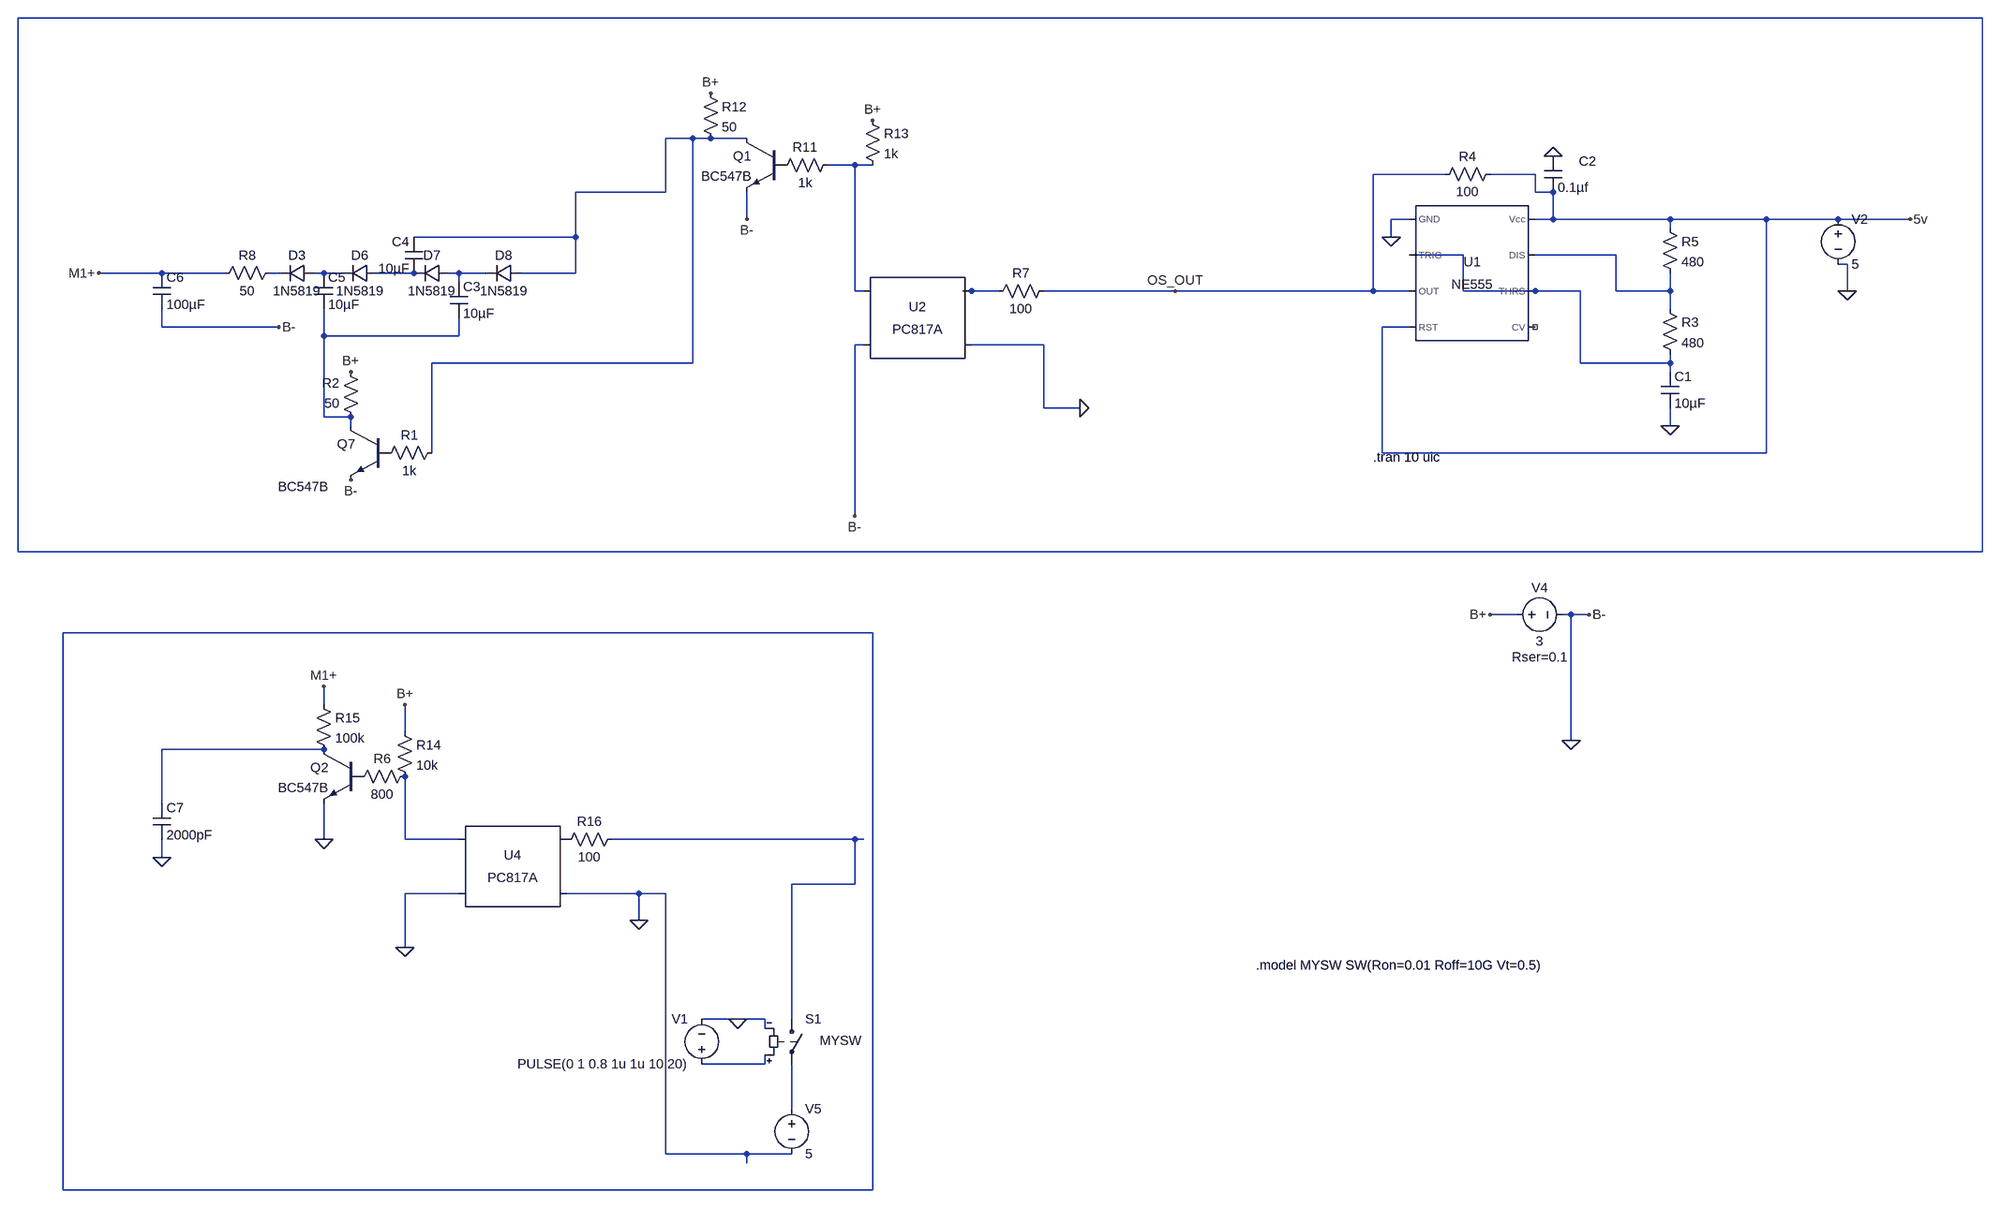
[diagram p0: schematic MOSFET_driver_circuit.asc]
MOSFET_driver_circuit.asc, the LTspice schematic file:
Version 4.1
SHEET 1 2420 1616
WIRE 2416 -1232 -1232 -1232
WIRE -32 -1008 -80 -1008
WIRE 0 -1008 -32 -1008
WIRE 64 -1008 0 -1008
WIRE 256 -960 208 -960
WIRE 288 -960 256 -960
WIRE 1456 -944 1328 -944
WIRE 1616 -944 1536 -944
WIRE -80 -912 -80 -1008
WIRE -80 -912 -240 -912
WIRE 1616 -912 1616 -944
WIRE 1648 -912 1616 -912
WIRE 64 -864 64 -912
WIRE 1392 -864 1360 -864
WIRE 1648 -864 1648 -912
WIRE 1648 -864 1616 -864
WIRE 1856 -864 1648 -864
WIRE 2032 -864 1856 -864
WIRE 2160 -864 2032 -864
WIRE 2288 -864 2160 -864
WIRE 1856 -848 1856 -864
WIRE -240 -832 -240 -912
WIRE -240 -832 -528 -832
WIRE 1360 -832 1360 -864
WIRE 1488 -800 1392 -800
WIRE 1760 -800 1616 -800
WIRE 2176 -784 2160 -784
WIRE -976 -768 -1088 -768
WIRE -864 -768 -976 -768
WIRE -768 -768 -784 -768
WIRE -688 -768 -704 -768
WIRE -656 -768 -688 -768
WIRE -528 -768 -592 -768
WIRE -448 -768 -464 -768
WIRE -400 -768 -448 -768
WIRE -240 -768 -240 -832
WIRE -240 -768 -336 -768
WIRE -448 -752 -448 -768
WIRE 256 -736 256 -960
WIRE 272 -736 256 -736
WIRE 464 -736 448 -736
WIRE 512 -736 464 -736
WIRE 976 -736 592 -736
WIRE 1328 -736 1328 -944
WIRE 1328 -736 976 -736
WIRE 1392 -736 1328 -736
WIRE 1488 -736 1488 -800
WIRE 1616 -736 1488 -736
WIRE 1696 -736 1616 -736
WIRE 1760 -736 1760 -800
WIRE 1856 -736 1856 -768
WIRE 1856 -736 1760 -736
WIRE 2176 -736 2176 -784
WIRE 1856 -704 1856 -736
WIRE -976 -672 -976 -704
WIRE -768 -672 -976 -672
WIRE 1392 -672 1344 -672
WIRE -688 -656 -688 -704
WIRE -448 -656 -448 -688
WIRE -448 -656 -688 -656
WIRE 272 -640 256 -640
WIRE 592 -640 464 -640
WIRE -32 -608 -32 -1008
WIRE -32 -608 -496 -608
WIRE 1696 -608 1696 -736
WIRE 1856 -608 1856 -624
WIRE 1856 -608 1696 -608
WIRE 1856 -592 1856 -608
WIRE 592 -528 592 -640
WIRE 656 -528 592 -528
WIRE -688 -512 -688 -656
WIRE -640 -512 -688 -512
WIRE -640 -496 -640 -512
WIRE 1856 -496 1856 -528
WIRE -496 -448 -496 -608
WIRE 1344 -448 1344 -672
WIRE 2032 -448 2032 -864
WIRE 2032 -448 1344 -448
WIRE 256 -336 256 -640
WIRE -1232 -272 -1232 -1232
WIRE 2416 -272 2416 -1232
WIRE 2416 -272 -1232 -272
WIRE 1584 -160 1536 -160
WIRE 1680 -160 1664 -160
WIRE 1712 -160 1680 -160
WIRE 288 -128 -1152 -128
WIRE -688 0 -688 -32
WIRE -544 48 -544 0
WIRE 1680 64 1680 -160
WIRE -688 80 -976 80
WIRE -976 176 -976 80
WIRE -688 240 -688 176
WIRE -544 240 -544 128
WIRE -448 240 -544 240
WIRE 256 240 -176 240
WIRE 272 240 256 240
WIRE -976 272 -976 240
WIRE 256 320 256 240
WIRE 256 320 144 320
WIRE -448 336 -544 336
WIRE -128 336 -256 336
WIRE -80 336 -128 336
WIRE -128 384 -128 336
WIRE -544 432 -544 336
WIRE 48 560 -16 560
WIRE 96 560 48 560
WIRE 144 560 144 320
WIRE 96 576 96 560
WIRE 96 640 96 624
WIRE 96 640 -16 640
WIRE 144 720 144 640
WIRE -80 800 -80 336
WIRE 64 800 -80 800
WIRE 144 800 64 800
WIRE 64 816 64 800
WIRE -1152 864 -1152 -128
WIRE 288 864 288 -128
WIRE 288 864 -1152 864
FLAG 1648 -976 0
FLAG 1856 -496 0
FLAG 1360 -832 0
FLAG 2176 -736 0
FLAG 2288 -864 5v
FLAG -768 -672 B-
FLAG -1088 -768 M1+
FLAG 656 -528 0
FLAG 976 -736 OS_OUT
FLAG 1536 -160 B+
FLAG 1712 -160 B-
FLAG 1680 64 0
FLAG 288 -1040 B+
FLAG -640 -400 B-
FLAG -640 -592 B+
FLAG 64 -864 B-
FLAG 0 -1088 B+
FLAG 48 560 0
FLAG -688 -32 M1+
FLAG -544 0 B+
FLAG -544 432 0
FLAG -128 384 0
FLAG -976 272 0
FLAG -688 240 0
FLAG 256 -336 B-
SYMBOL Misc\\NE555 1504 -768 R0
SYMATTR InstName U1
SYMBOL res 1840 -720 R0
SYMATTR InstName R3
SYMATTR Value 480
SYMBOL cap 1840 -592 R0
SYMATTR InstName C1
SYMATTR Value 10µF
SYMBOL cap 1632 -976 R0
WINDOW 0 62 9 Left 2
SYMATTR InstName C2
SYMATTR Value 0.1µf
SYMBOL res 1552 -960 R90
WINDOW 0 0 56 VBottom 2
WINDOW 3 32 56 VTop 2
SYMATTR InstName R4
SYMATTR Value 100
SYMBOL voltage 2160 -880 R0
WINDOW 123 0 0 Left 0
WINDOW 39 0 0 Left 0
SYMATTR InstName V2
SYMATTR Value 5
SYMBOL res 1840 -864 R0
SYMATTR InstName R5
SYMATTR Value 480
SYMBOL cap -464 -752 R0
SYMATTR InstName C3
SYMATTR Value 10µF
SYMBOL cap -512 -768 R180
WINDOW 0 24 56 Left 2
WINDOW 3 24 8 Left 2
SYMATTR InstName C4
SYMATTR Value 10µF
SYMBOL cap -704 -768 R0
SYMATTR InstName C5
SYMATTR Value 10µF
SYMBOL lib\\sym\\Optos\\PC817A 368 -688 M0
SYMATTR InstName U2
SYMBOL res 608 -752 R90
WINDOW 0 0 56 VBottom 2
WINDOW 3 32 56 VTop 2
SYMATTR InstName R7
SYMATTR Value 100
SYMBOL diode -704 -784 R90
WINDOW 0 0 32 VBottom 2
WINDOW 3 32 32 VTop 2
SYMATTR InstName D3
SYMATTR Value 1N5819
SYMBOL cap -992 -768 R0
SYMATTR InstName C6
SYMATTR Value 100µF
SYMBOL res -768 -784 R90
WINDOW 0 0 56 VBottom 2
WINDOW 3 32 56 VTop 2
SYMATTR InstName R8
SYMATTR Value 50
SYMBOL diode -592 -784 R90
WINDOW 0 0 32 VBottom 2
WINDOW 3 32 32 VTop 2
SYMATTR InstName D6
SYMATTR Value 1N5819
SYMBOL diode -464 -784 R90
WINDOW 0 0 32 VBottom 2
WINDOW 3 32 32 VTop 2
SYMATTR InstName D7
SYMATTR Value 1N5819
SYMBOL diode -336 -784 R90
WINDOW 0 0 32 VBottom 2
WINDOW 3 32 32 VTop 2
SYMATTR InstName D8
SYMATTR Value 1N5819
SYMBOL voltage 1568 -160 R270
WINDOW 0 32 56 VTop 2
WINDOW 3 -32 56 VBottom 2
WINDOW 123 0 0 Left 0
WINDOW 39 -60 56 VBottom 2
SYMATTR InstName V4
SYMATTR Value 3
SYMATTR SpiceLine Rser=0.1
SYMBOL res 272 -1056 R0
SYMATTR InstName R13
SYMATTR Value 1k
SYMBOL lib\\sym\\npn -576 -496 M0
WINDOW 3 104 108 Left 2
SYMATTR Value BC547B
SYMATTR InstName Q7
SYMBOL res -480 -464 R90
WINDOW 0 0 56 VBottom 2
WINDOW 3 32 56 VTop 2
SYMATTR InstName R1
SYMATTR Value 1k
SYMBOL res -624 -496 R180
WINDOW 0 36 76 Left 2
WINDOW 3 36 40 Left 2
SYMATTR InstName R2
SYMATTR Value 50
SYMBOL lib\\sym\\npn 128 -1008 M0
SYMATTR InstName Q1
SYMATTR Value BC547B
SYMBOL res 224 -976 R90
WINDOW 0 0 56 VBottom 2
WINDOW 3 32 56 VTop 2
SYMATTR InstName R11
SYMATTR Value 1k
SYMBOL res -16 -1104 R0
SYMATTR InstName R12
SYMATTR Value 50
SYMBOL lib\\sym\\sw 144 544 R0
WINDOW 3 50 54 Left 2
SYMATTR Value MYSW
SYMATTR InstName S1
SYMBOL cap -992 176 R0
SYMATTR InstName C7
SYMATTR Value 2000pF
SYMBOL voltage -16 656 R180
WINDOW 0 24 96 Left 2
WINDOW 3 24 16 Left 2
WINDOW 123 0 0 Left 0
WINDOW 39 0 0 Left 0
SYMATTR InstName V1
SYMATTR Value PULSE(0 1 0.8 1u 1u 10 20)
SYMBOL lib\\sym\\Optos\\PC817A -352 288 M0
SYMATTR InstName U4
SYMBOL lib\\sym\\npn -624 80 M0
SYMATTR InstName Q2
SYMATTR Value BC547B
SYMBOL res -640 144 R270
WINDOW 0 32 56 VTop 2
WINDOW 3 0 56 VBottom 2
SYMATTR InstName R6
SYMATTR Value 800
SYMBOL res -560 32 R0
SYMATTR InstName R14
SYMATTR Value 10k
SYMBOL res -704 -16 R0
SYMATTR InstName R15
SYMATTR Value 100k
SYMBOL voltage 144 704 R0
WINDOW 123 0 0 Left 0
WINDOW 39 0 0 Left 0
SYMATTR InstName V5
SYMATTR Value 5
SYMBOL res -160 224 R90
WINDOW 0 0 56 VBottom 2
WINDOW 3 32 56 VTop 2
SYMATTR InstName R16
SYMATTR Value 100
TEXT 1328 -440 Left 2 !.tran 10 uic
TEXT 1120 464 Left 2 !.model MYSW SW(Ron=0.01 Roff=10G Vt=0.5)

The netlist it stands for:
* MOSFET_driver_circuit.asc
X§U1 0 N004 OS_OUT 5v NC_01 N004 N005 5v NE555  ; pins GND TRIG OUT RST CV THRS DIS Vcc
R3 N005 N004 480
C1 N004 0 10µF
C2 0 5v 0.1µf
R4 5v OS_OUT 100
V2 5v 0 5
R5 5v N005 480
C3 N009 N011 10µF
C4 N008 N002 10µF
C5 N007 N011 10µF
X§U2 N010 0 N003 0 PC817 Igain=1m
R7 OS_OUT N010 100
D3 N007 N006 1N5819
C6 M1+ 0 100µF
R8 N006 M1+ 50
D6 N008 N007 1N5819
D7 N009 N008 1N5819
D8 N002 N009 1N5819
V4 B+ 0 3 Rser=0.1
R13 B+ N003 1k
Q7 N011 P001 0 0 BC547B
R1 N002 P001 1k
R2 N011 B+ 50
Q1 N002 P002 0 0 BC547B
R11 N003 P002 1k
R12 B+ N002 50
S1 N015 N017 N016 0 MYSW
C7 N013 0 2000pF
V1 N016 0 PULSE(0 1 0.8 1u 1u 10 20)
X§U4 P003 0 N014 0 PC817 Igain=1m
Q2 N013 P004 0 0 BC547B
R6 P004 N014 800
R14 B+ N014 10k
R15 M1+ N013 100k
V5 N017 0 5
R16 N015 P003 100
.model D D
.lib standard.dio
.model NPN NPN
.model PNP PNP
.lib standard.bjt
.tran 10 uic
.model MYSW SW(Ron=0.01 Roff=10G Vt=0.5)
.lib NE555.sub
.lib PC817.sub
.backanno
.end